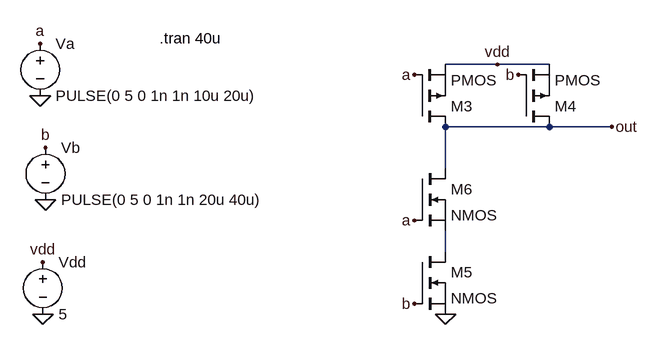
[diagram p0: schematic nand.asc]
nand.asc, the LTspice schematic file:
Version 4.1
SHEET 1 1400 800
WIRE 288 96 208 96
WIRE 368 96 288 96
WIRE 368 192 208 192
WIRE 464 192 368 192
WIRE 208 256 208 192
WIRE 208 384 208 352
FLAG 288 96 vdd
FLAG 464 192 out
FLAG 160 112 a
FLAG 160 336 a
FLAG 320 112 b
FLAG 160 464 b
FLAG 208 480 0
FLAG -412 400 vdd
FLAG -412 480 0
FLAG -408 224 b
FLAG -408 304 0
FLAG -416 64 a
FLAG -416 144 0
SYMBOL voltage -412 384 R0
SYMATTR InstName Vdd
SYMATTR Value 5
SYMBOL voltage -408 208 R0
SYMATTR InstName Vb
SYMATTR Value PULSE(0 5 0 1n 1n 20u 40u)
SYMBOL voltage -416 48 R0
SYMATTR InstName Va
SYMATTR Value PULSE(0 5 0 1n 1n 10u 20u)
SYMBOL nmos 160 384 R0
SYMATTR InstName M5
SYMBOL nmos 160 256 R0
SYMATTR InstName M6
SYMBOL pmos 160 192 M180
SYMATTR InstName M3
SYMBOL pmos 320 192 M180
SYMATTR InstName M4
TEXT -232 56 Left 2 !.tran 40u

The netlist it stands for:
* nand.asc
Vdd vdd 0 5
Vb b 0 PULSE(0 5 0 1n 1n 20u 40u)
Va a 0 PULSE(0 5 0 1n 1n 10u 20u)
M5 N001 b 0 0 NMOS
M6 out a N001 N001 NMOS
M3 out a vdd vdd PMOS
M4 out b vdd vdd PMOS
.model NMOS NMOS
.model PMOS PMOS
.lib standard.mos
.tran 40u
.backanno
.end